# EasyEDA Pro project SOP100E 2025.05.27.eprj, board PCB1
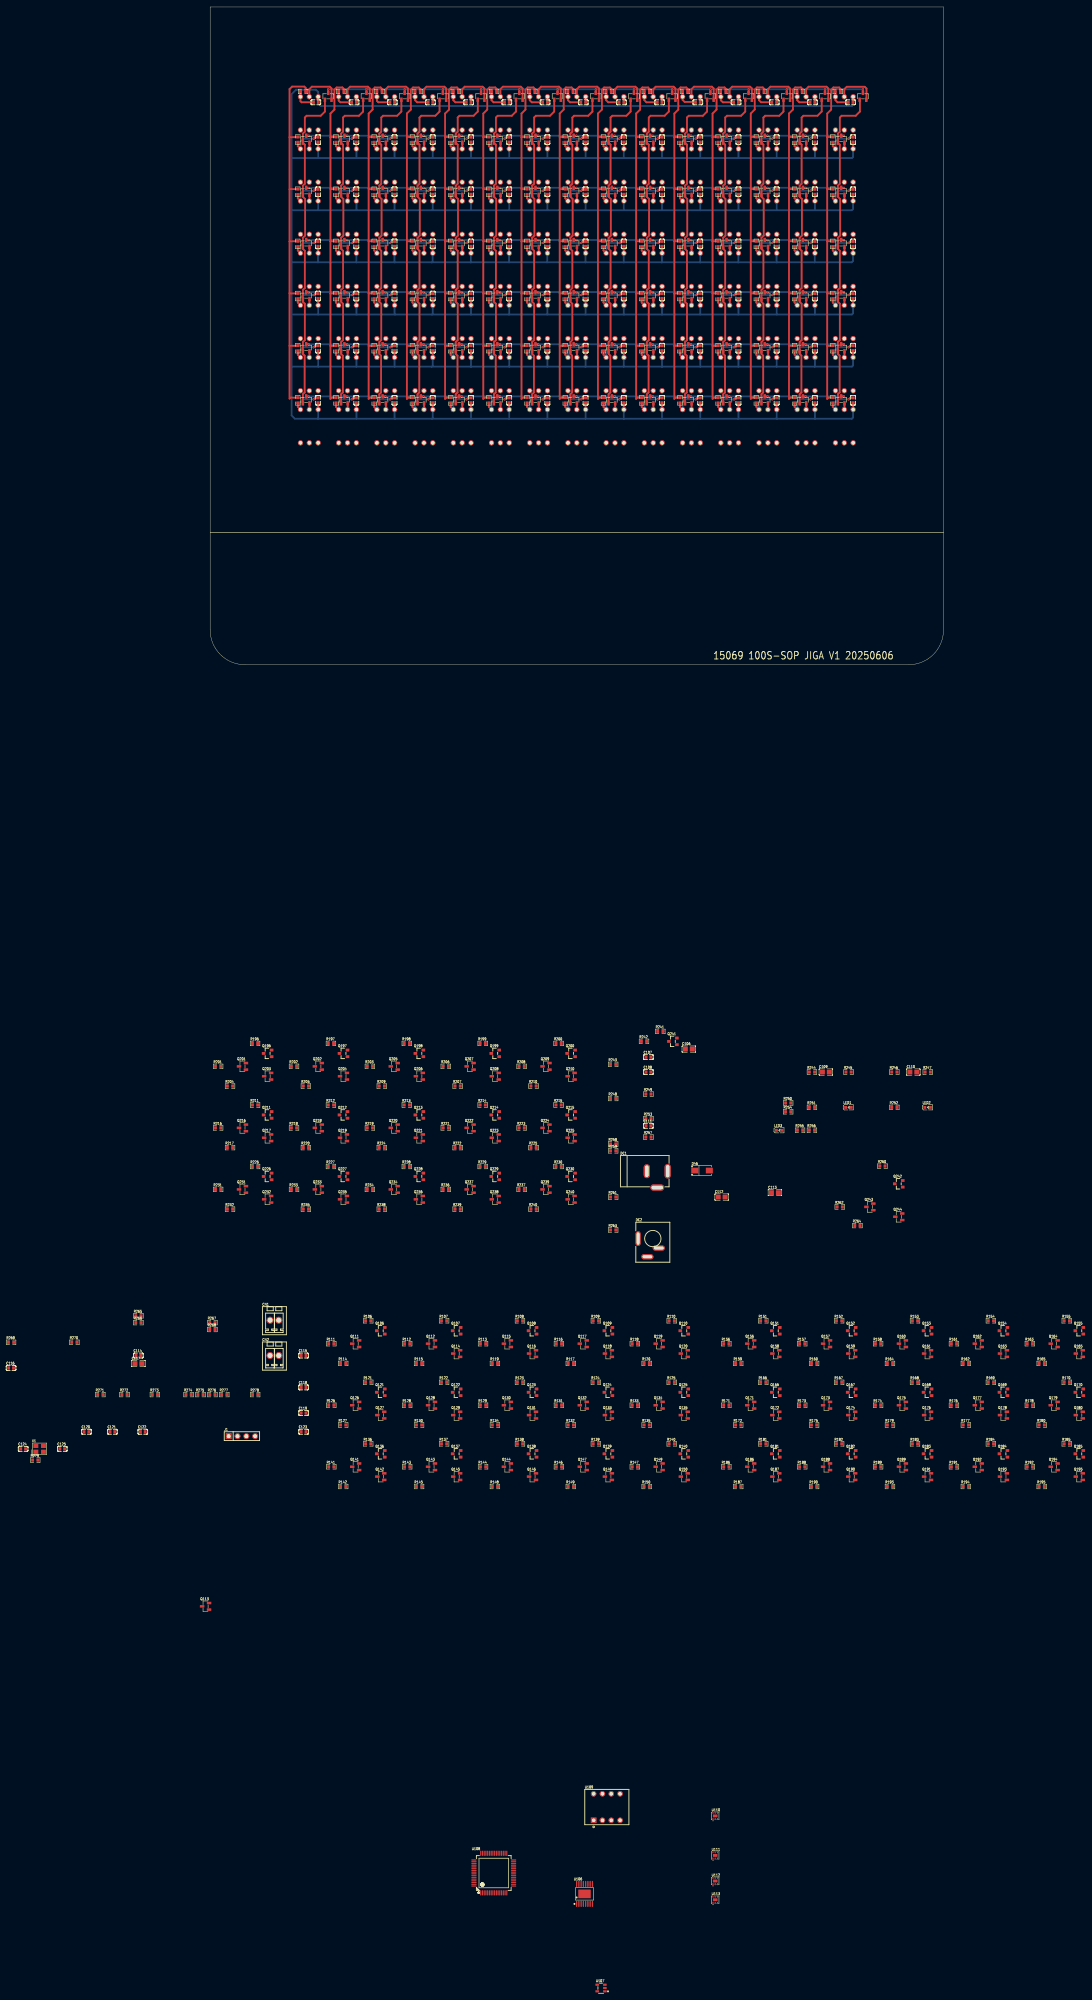
[diagram p15: board, top side]
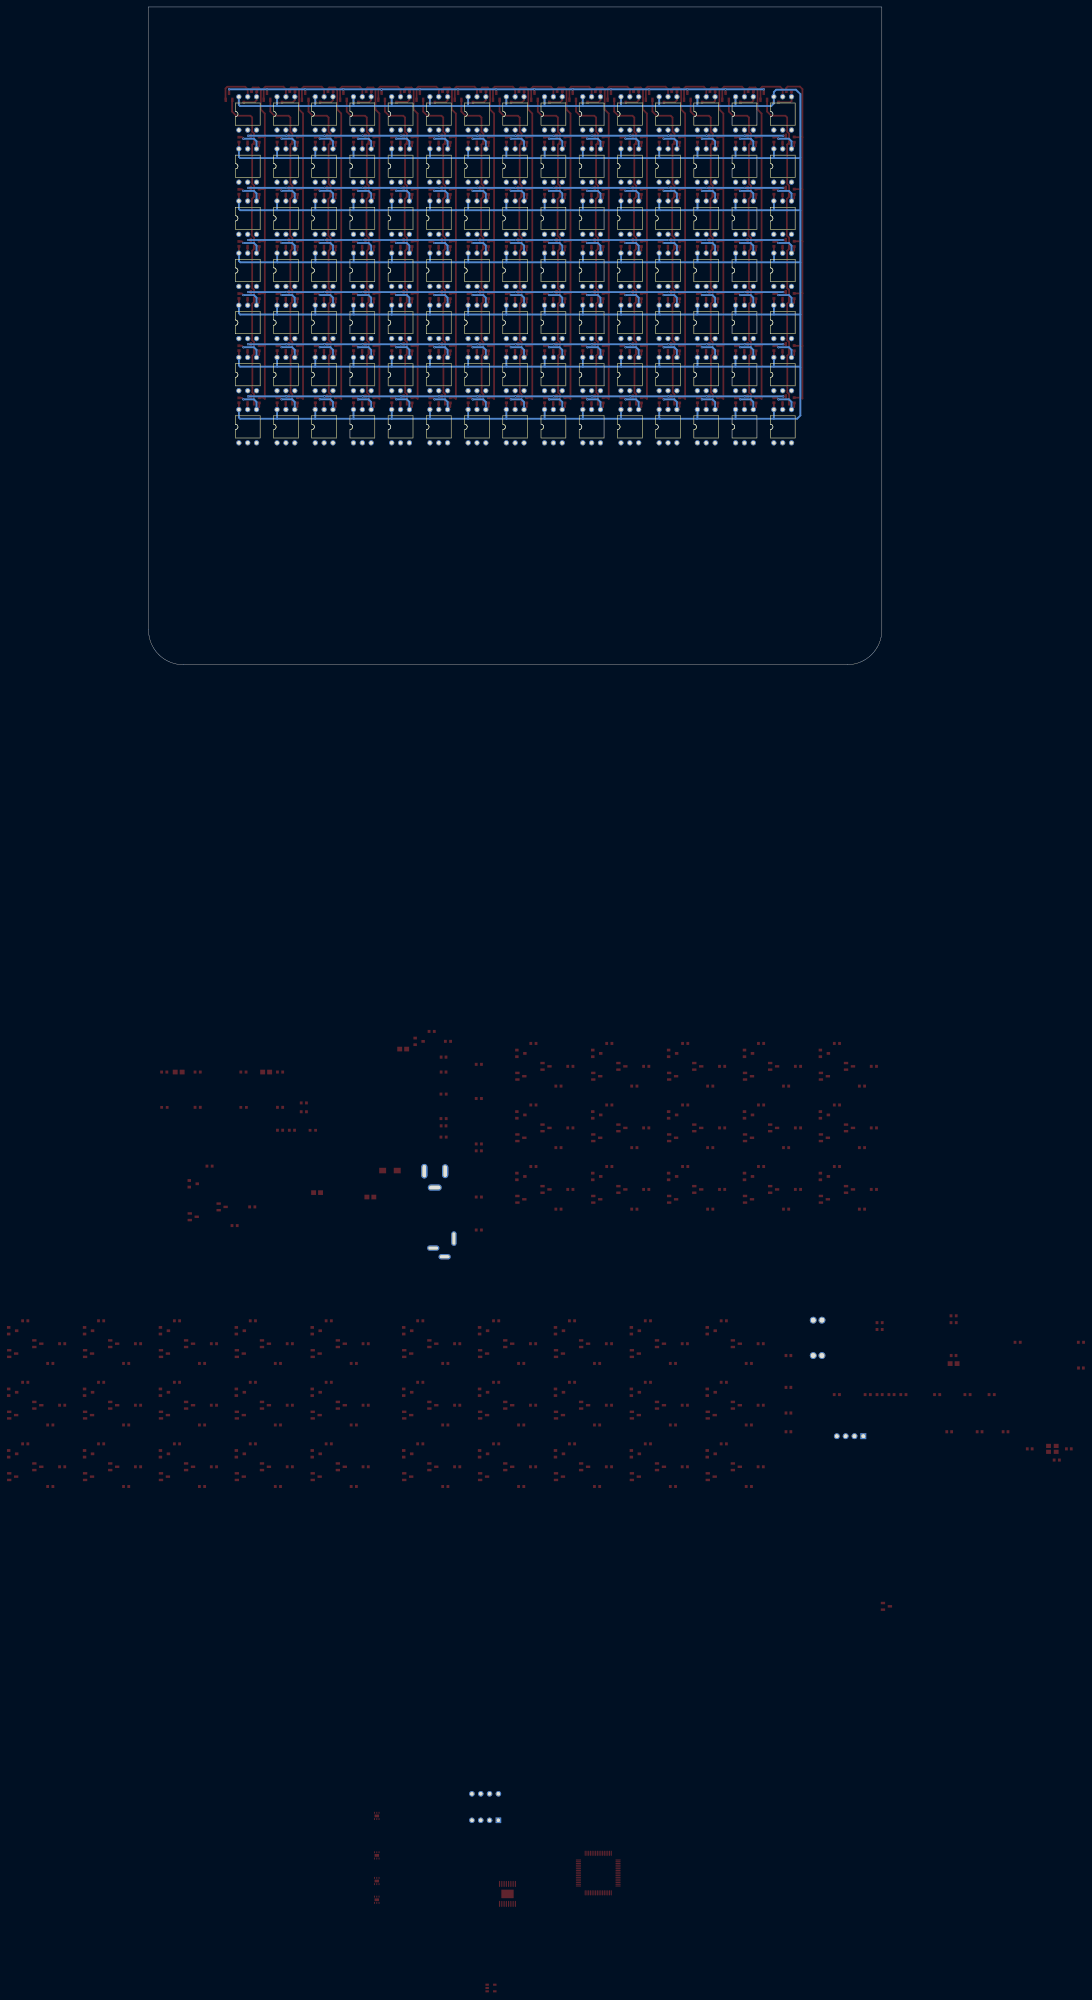
[diagram p16: board, bottom side, seen from below]

Outline 211.1 x 189.25 mm; copper layers: Top Layer, Inner1, Inner2, Bottom Layer. Coordinates in mm from the lower left corner of the outline.
Outline path: 0,189.25 211.1,189.25 211.1,10 arc(208.17,2.93) 201.1,0 10,0 arc(2.93,2.93) 0,10 0,189.25
Stack: Top Layer 0.035mm 外层铜厚1oz / Dielectric1 0.2104mm 7628 RC49% 8.6mil / Inner1 0.0152mm 内层铜厚 / Dielectric2 1.065mm 1.1mm H/HOZ Copper / Inner2 0.0152mm 内层铜厚 / Dielectric3 0.2104mm 7628 RC49% 8.6mil / Bottom Layer 0.035mm 外层铜厚1oz

## Design rules (mm)
template: JLCPCB Capability(Two Layers Board)
spacing copperThickness1oz (default): track to track 0.102, other pairs 0.152 to 0.3
spacing copperThickness2oz: track to track 0.203, other pairs 0.152 to 0.3
track width copperThickness1oz (default): min 0.127, default 0.254, max 2.54
track width copperThickness2oz: min 0.203, default 0.254, max 2.54
differential pair differentialPair (default): width min 0.127, default 0.254, max 2.54; gap min 0.152, default 0.152
via viaSize (default): diameter min 0.5, default 0.61, max 10; hole min 0.3, default 0.305, max 6.3

## Placement (name value [footprint] x y rotation side)
C1  100nF  [C0603]  30.43 161.82 180 top
C2  100nF  [C0603]  41.43 161.82 180 top
C3  100nF  [C0603]  52.42 161.82 180 top
C4  100nF  [C0603]  63.42 161.82 180 top
C5  100nF  [C0603]  74.41 161.82 180 top
C6  100nF  [C0603]  85.41 161.82 180 top
C7  100nF  [C0603]  96.41 161.82 180 top
C8  100nF  [C0603]  107.4 161.82 180 top
C9  100nF  [C0603]  118.4 161.82 180 top
C10  100nF  [C0603]  129.39 161.82 180 top
C11  100nF  [C0603]  140.39 161.82 180 top
C12  100nF  [C0603]  151.38 161.82 180 top
C13  100nF  [C0603]  162.38 161.82 180 top
C14  100nF  [C0603]  173.37 161.82 180 top
C15  100nF  [C0603]  184.37 161.82 180 top
C16  100nF  [C0603]  31.07 151.08 90 top
C17  100nF  [C0603]  42.07 151.08 90 top
C18  100nF  [C0603]  53.07 151.08 90 top
C19  100nF  [C0603]  64.07 151.08 90 top
C20  100nF  [C0603]  75.07 151.08 90 top
C21  100nF  [C0603]  86.07 151.08 90 top
C22  100nF  [C0603]  97.07 151.08 90 top
C23  100nF  [C0603]  108.07 151.08 90 top
C24  100nF  [C0603]  119.07 151.08 90 top
C25  100nF  [C0603]  130.07 151.08 90 top
C26  100nF  [C0603]  141.07 151.08 90 top
C27  100nF  [C0603]  152.07 151.08 90 top
C28  100nF  [C0603]  163.07 151.08 90 top
C29  100nF  [C0603]  174.07 151.08 90 top
C30  100nF  [C0603]  185.07 151.08 90 top
C31  100nF  [C0603]  31.07 136.08 90 top
C32  100nF  [C0603]  42.07 136.08 90 top
C33  100nF  [C0603]  53.07 136.08 90 top
C34  100nF  [C0603]  64.07 136.08 90 top
C35  100nF  [C0603]  75.07 136.08 90 top
C36  100nF  [C0603]  86.07 136.08 90 top
C37  100nF  [C0603]  97.07 136.08 90 top
C38  100nF  [C0603]  108.07 136.08 90 top
C39  100nF  [C0603]  119.07 136.08 90 top
C40  100nF  [C0603]  130.07 136.08 90 top
C41  100nF  [C0603]  141.07 136.08 90 top
C42  100nF  [C0603]  152.07 136.08 90 top
C43  100nF  [C0603]  163.07 136.08 90 top
C44  100nF  [C0603]  174.07 136.08 90 top
C45  100nF  [C0603]  185.07 136.08 90 top
C46  100nF  [C0603]  31.07 121.08 90 top
C47  100nF  [C0603]  42.07 121.08 90 top
C48  100nF  [C0603]  53.07 121.08 90 top
C49  100nF  [C0603]  64.07 121.08 90 top
C50  100nF  [C0603]  75.07 121.08 90 top
C51  100nF  [C0603]  86.07 121.08 90 top
C52  100nF  [C0603]  97.07 121.08 90 top
C53  100nF  [C0603]  108.07 121.08 90 top
C54  100nF  [C0603]  119.07 121.08 90 top
C55  100nF  [C0603]  130.07 121.08 90 top
C56  100nF  [C0603]  141.07 121.08 90 top
C57  100nF  [C0603]  152.07 121.08 90 top
C58  100nF  [C0603]  163.07 121.08 90 top
C59  100nF  [C0603]  174.07 121.08 90 top
C60  100nF  [C0603]  185.07 121.08 90 top
C61  100nF  [C0603]  31.07 106.08 90 top
C62  100nF  [C0603]  42.07 106.08 90 top
C63  100nF  [C0603]  53.07 106.08 90 top
C64  100nF  [C0603]  64.07 106.08 90 top
C65  100nF  [C0603]  75.07 106.08 90 top
C66  100nF  [C0603]  86.07 106.08 90 top
C67  100nF  [C0603]  97.07 106.08 90 top
C68  100nF  [C0603]  108.07 106.08 90 top
C69  100nF  [C0603]  119.07 106.08 90 top
C70  100nF  [C0603]  130.07 106.08 90 top
C71  100nF  [C0603]  141.07 106.08 90 top
C72  100nF  [C0603]  152.07 106.08 90 top
C73  100nF  [C0603]  163.07 106.08 90 top
C74  100nF  [C0603]  174.07 106.08 90 top
C75  100nF  [C0603]  185.07 106.08 90 top
C76  100nF  [C0603]  31.07 91.08 90 top
C77  100nF  [C0603]  42.07 91.08 90 top
C78  100nF  [C0603]  53.07 91.08 90 top
C79  100nF  [C0603]  64.07 91.08 90 top
C80  100nF  [C0603]  75.07 91.08 90 top
C81  100nF  [C0603]  86.07 91.08 90 top
C82  100nF  [C0603]  97.07 91.08 90 top
C83  100nF  [C0603]  108.07 91.08 90 top
C84  100nF  [C0603]  119.07 91.08 90 top
C85  100nF  [C0603]  130.07 91.08 90 top
C86  100nF  [C0603]  141.07 91.08 90 top
C87  100nF  [C0603]  152.07 91.08 90 top
C88  100nF  [C0603]  163.07 91.08 90 top
C89  100nF  [C0603]  174.07 91.08 90 top
C90  100nF  [C0603]  185.07 91.08 90 top
C91  100nF  [C0603]  31.07 76.08 90 top
C92  100nF  [C0603]  42.07 76.08 90 top
C93  100nF  [C0603]  53.07 76.08 90 top
C94  100nF  [C0603]  64.07 76.08 90 top
C95  100nF  [C0603]  75.07 76.08 90 top
C96  100nF  [C0603]  86.07 76.08 90 top
C97  100nF  [C0603]  97.07 76.08 90 top
C98  100nF  [C0603]  108.07 76.08 90 top
C99  100nF  [C0603]  119.07 76.08 90 top
C100  100nF  [C0603]  130.07 76.08 90 top
C101  100nF  [C0603]  141.07 76.08 90 top
C102  100nF  [C0603]  152.07 76.08 90 top
C103  100nF  [C0603]  163.07 76.08 90 top
C104  100nF  [C0603]  174.07 76.08 90 top
C105  100nF  [C0603]  185.07 76.08 90 top
C106  22uF  [C0805]  137.79 -110.59 0 top
C107  1uF  [C0603]  126.16 -112.91 0 top
C108  1uF  [C0603]  126.16 -117.2 0 top
C109  22uF  [C0805]  177.24 -117.2 0 top
C110  22uF  [C0805]  202.42 -117.2 0 top
C111  1uF  [C0603]  126.16 -132.68 0 top
C112  22uF  [C0805]  147.24 -153.16 0 top
C113  22uF  [C0805]  162.58 -151.9 0 top
C114  100nF  [C0603]  -20.66 -198.77 0 top
C115  100nF  [C0603]  26.9 -198.77 0 top
C116  100nF  [C0603]  -57.31 -202.36 0 top
C117  22uF  [C0805]  -20.66 -201.09 0 top
C118  100nF  [C0603]  26.9 -207.94 0 top
C119  100nF  [C0603]  26.9 -215.31 0 top
C120  100nF  [C0603]  -35.61 -220.7 0 top
C121  100nF  [C0603]  -28.14 -220.7 0 top
C122  100nF  [C0603]  -19.39 -220.7 0 top
C123  100nF  [C0603]  26.9 -220.7 0 top
C124  10pF  [C0603]  -53.83 -225.63 0 top
C125  10pF  [C0603]  -42.57 -225.63 0 top
CN1  DB2EVC-2.5-2P-GN  [CONN-TH_2P-P2.50_DB2EVC-2.5-2P-GN]  18.5 -188.6 0 top
CN2  DB2EVC-2.5-2P-GN  [CONN-TH_2P-P2.50_DB2EVC-2.5-2P-GN]  18.5 -198.77 0 top
D46  SS34  [SMA_L4.3-W2.5-LS5.0-RD]  141.6 -145.54 0 top
DC1  DC-005-5A-2.0  [DC-IN-TH_DC-005-5A-2.0]  128.7 -148.09 0 top
DC2  DC-012A-B200  [dc-in-th_dc-012a-b200]  126.16 -167.73 0 top
J1  PZ254V-11-04P  [HDR-TH_4P-P2.54-V-M]  9.15 -221.97 0 top
LED1  -  [LED_0603]  183.78 -127.36 0 top
LED2  -  [LED_0603]  206.57 -127.36 0 top
LED3  -  [LED_0603]  163.85 -133.95 0 top
Q1  AO3400A  [SOT-23-3_L2.9-W1.3-P1.90-LS2.4-BR]  33.99 163.54 270 top
Q2  AO3400A  [SOT-23-3_L2.9-W1.3-P1.90-LS2.4-BR]  44.99 163.54 270 top
Q3  AO3400A  [SOT-23-3_L2.9-W1.3-P1.90-LS2.4-BR]  55.99 163.54 270 top
Q4  AO3400A  [SOT-23-3_L2.9-W1.3-P1.90-LS2.4-BR]  66.99 163.54 270 top
Q5  AO3400A  [SOT-23-3_L2.9-W1.3-P1.90-LS2.4-BR]  77.99 163.54 270 top
Q6  AO3400A  [SOT-23-3_L2.9-W1.3-P1.90-LS2.4-BR]  88.99 163.54 270 top
Q7  AO3400A  [SOT-23-3_L2.9-W1.3-P1.90-LS2.4-BR]  99.99 163.54 270 top
Q8  AO3400A  [SOT-23-3_L2.9-W1.3-P1.90-LS2.4-BR]  110.99 163.54 270 top
Q9  AO3400A  [SOT-23-3_L2.9-W1.3-P1.90-LS2.4-BR]  121.99 163.54 270 top
Q10  AO3400A  [SOT-23-3_L2.9-W1.3-P1.90-LS2.4-BR]  132.99 163.54 270 top
Q11  AO3400A  [SOT-23-3_L2.9-W1.3-P1.90-LS2.4-BR]  143.99 163.54 270 top
Q12  AO3400A  [SOT-23-3_L2.9-W1.3-P1.90-LS2.4-BR]  154.99 163.54 270 top
Q13  AO3400A  [SOT-23-3_L2.9-W1.3-P1.90-LS2.4-BR]  165.99 163.54 270 top
Q14  AO3400A  [SOT-23-3_L2.9-W1.3-P1.90-LS2.4-BR]  176.99 163.54 270 top
Q15  AO3400A  [SOT-23-3_L2.9-W1.3-P1.90-LS2.4-BR]  187.91 163.54 270 top
Q16  AO3400A  [SOT-23-3_L2.9-W1.3-P1.90-LS2.4-BR]  27.64 151.2 270 top
Q17  AO3400A  [SOT-23-3_L2.9-W1.3-P1.90-LS2.4-BR]  38.64 151.2 270 top
Q18  AO3400A  [SOT-23-3_L2.9-W1.3-P1.90-LS2.4-BR]  49.64 151.2 270 top
Q19  AO3400A  [SOT-23-3_L2.9-W1.3-P1.90-LS2.4-BR]  60.64 151.2 270 top
Q20  AO3400A  [SOT-23-3_L2.9-W1.3-P1.90-LS2.4-BR]  71.64 151.2 270 top
Q21  AO3400A  [SOT-23-3_L2.9-W1.3-P1.90-LS2.4-BR]  82.64 151.2 270 top
Q22  AO3400A  [SOT-23-3_L2.9-W1.3-P1.90-LS2.4-BR]  93.64 151.2 270 top
Q23  AO3400A  [SOT-23-3_L2.9-W1.3-P1.90-LS2.4-BR]  104.64 151.2 270 top
Q24  AO3400A  [SOT-23-3_L2.9-W1.3-P1.90-LS2.4-BR]  115.64 151.2 270 top
Q25  AO3400A  [SOT-23-3_L2.9-W1.3-P1.90-LS2.4-BR]  126.64 151.2 270 top
Q26  AO3400A  [SOT-23-3_L2.9-W1.3-P1.90-LS2.4-BR]  137.64 151.2 270 top
Q27  AO3400A  [SOT-23-3_L2.9-W1.3-P1.90-LS2.4-BR]  148.64 151.2 270 top
Q28  AO3400A  [SOT-23-3_L2.9-W1.3-P1.90-LS2.4-BR]  159.64 151.2 270 top
Q29  AO3400A  [SOT-23-3_L2.9-W1.3-P1.90-LS2.4-BR]  170.64 151.2 270 top
Q30  AO3400A  [SOT-23-3_L2.9-W1.3-P1.90-LS2.4-BR]  181.64 151.2 270 top
Q31  AO3400A  [SOT-23-3_L2.9-W1.3-P1.90-LS2.4-BR]  27.64 136.2 270 top
Q32  AO3400A  [SOT-23-3_L2.9-W1.3-P1.90-LS2.4-BR]  38.64 136.2 270 top
Q33  AO3400A  [SOT-23-3_L2.9-W1.3-P1.90-LS2.4-BR]  49.64 136.2 270 top
Q34  AO3400A  [SOT-23-3_L2.9-W1.3-P1.90-LS2.4-BR]  60.64 136.2 270 top
Q35  AO3400A  [SOT-23-3_L2.9-W1.3-P1.90-LS2.4-BR]  71.64 136.2 270 top
Q36  AO3400A  [SOT-23-3_L2.9-W1.3-P1.90-LS2.4-BR]  82.64 136.2 270 top
Q37  AO3400A  [SOT-23-3_L2.9-W1.3-P1.90-LS2.4-BR]  93.64 136.2 270 top
Q38  AO3400A  [SOT-23-3_L2.9-W1.3-P1.90-LS2.4-BR]  104.64 136.2 270 top
Q39  AO3400A  [SOT-23-3_L2.9-W1.3-P1.90-LS2.4-BR]  115.64 136.2 270 top
Q40  AO3400A  [SOT-23-3_L2.9-W1.3-P1.90-LS2.4-BR]  126.64 136.2 270 top
Q41  AO3400A  [SOT-23-3_L2.9-W1.3-P1.90-LS2.4-BR]  137.64 136.2 270 top
Q42  AO3400A  [SOT-23-3_L2.9-W1.3-P1.90-LS2.4-BR]  148.64 136.2 270 top
Q43  AO3400A  [SOT-23-3_L2.9-W1.3-P1.90-LS2.4-BR]  159.64 136.2 270 top
Q44  AO3400A  [SOT-23-3_L2.9-W1.3-P1.90-LS2.4-BR]  170.64 136.2 270 top
Q45  AO3400A  [SOT-23-3_L2.9-W1.3-P1.90-LS2.4-BR]  181.64 136.2 270 top
Q46  AO3400A  [SOT-23-3_L2.9-W1.3-P1.90-LS2.4-BR]  27.64 121.2 270 top
Q47  AO3400A  [SOT-23-3_L2.9-W1.3-P1.90-LS2.4-BR]  38.64 121.2 270 top
Q48  AO3400A  [SOT-23-3_L2.9-W1.3-P1.90-LS2.4-BR]  49.64 121.2 270 top
Q49  AO3400A  [SOT-23-3_L2.9-W1.3-P1.90-LS2.4-BR]  60.64 121.2 270 top
Q50  AO3400A  [SOT-23-3_L2.9-W1.3-P1.90-LS2.4-BR]  71.64 121.2 270 top
Q51  AO3400A  [SOT-23-3_L2.9-W1.3-P1.90-LS2.4-BR]  82.64 121.2 270 top
Q52  AO3400A  [SOT-23-3_L2.9-W1.3-P1.90-LS2.4-BR]  93.64 121.2 270 top
Q53  AO3400A  [SOT-23-3_L2.9-W1.3-P1.90-LS2.4-BR]  104.64 121.2 270 top
Q54  AO3400A  [SOT-23-3_L2.9-W1.3-P1.90-LS2.4-BR]  115.64 121.2 270 top
Q55  AO3400A  [SOT-23-3_L2.9-W1.3-P1.90-LS2.4-BR]  126.64 121.2 270 top
Q56  AO3400A  [SOT-23-3_L2.9-W1.3-P1.90-LS2.4-BR]  137.64 121.2 270 top
Q57  AO3400A  [SOT-23-3_L2.9-W1.3-P1.90-LS2.4-BR]  148.64 121.2 270 top
Q58  AO3400A  [SOT-23-3_L2.9-W1.3-P1.90-LS2.4-BR]  159.64 121.2 270 top
Q59  AO3400A  [SOT-23-3_L2.9-W1.3-P1.90-LS2.4-BR]  170.64 121.2 270 top
Q60  AO3400A  [SOT-23-3_L2.9-W1.3-P1.90-LS2.4-BR]  181.64 121.2 270 top
Q61  AO3400A  [SOT-23-3_L2.9-W1.3-P1.90-LS2.4-BR]  27.64 106.2 270 top
Q62  AO3400A  [SOT-23-3_L2.9-W1.3-P1.90-LS2.4-BR]  38.64 106.2 270 top
Q63  AO3400A  [SOT-23-3_L2.9-W1.3-P1.90-LS2.4-BR]  49.64 106.2 270 top
Q64  AO3400A  [SOT-23-3_L2.9-W1.3-P1.90-LS2.4-BR]  60.64 106.2 270 top
Q65  AO3400A  [SOT-23-3_L2.9-W1.3-P1.90-LS2.4-BR]  71.64 106.2 270 top
Q66  AO3400A  [SOT-23-3_L2.9-W1.3-P1.90-LS2.4-BR]  82.64 106.2 270 top
Q67  AO3400A  [SOT-23-3_L2.9-W1.3-P1.90-LS2.4-BR]  93.64 106.2 270 top
Q68  AO3400A  [SOT-23-3_L2.9-W1.3-P1.90-LS2.4-BR]  104.64 106.2 270 top
Q69  AO3400A  [SOT-23-3_L2.9-W1.3-P1.90-LS2.4-BR]  115.64 106.2 270 top
Q70  AO3400A  [SOT-23-3_L2.9-W1.3-P1.90-LS2.4-BR]  126.64 106.2 270 top
Q71  AO3400A  [SOT-23-3_L2.9-W1.3-P1.90-LS2.4-BR]  137.64 106.2 270 top
Q72  AO3400A  [SOT-23-3_L2.9-W1.3-P1.90-LS2.4-BR]  148.64 106.2 270 top
Q73  AO3400A  [SOT-23-3_L2.9-W1.3-P1.90-LS2.4-BR]  159.64 106.2 270 top
Q74  AO3400A  [SOT-23-3_L2.9-W1.3-P1.90-LS2.4-BR]  170.64 106.2 270 top
Q75  AO3400A  [SOT-23-3_L2.9-W1.3-P1.90-LS2.4-BR]  181.64 106.2 270 top
Q76  AO3400A  [SOT-23-3_L2.9-W1.3-P1.90-LS2.4-BR]  27.64 91.2 270 top
Q77  AO3400A  [SOT-23-3_L2.9-W1.3-P1.90-LS2.4-BR]  38.64 91.2 270 top
Q78  AO3400A  [SOT-23-3_L2.9-W1.3-P1.90-LS2.4-BR]  49.64 91.2 270 top
Q79  AO3400A  [SOT-23-3_L2.9-W1.3-P1.90-LS2.4-BR]  60.64 91.2 270 top
Q80  AO3400A  [SOT-23-3_L2.9-W1.3-P1.90-LS2.4-BR]  71.64 91.2 270 top
Q81  AO3400A  [SOT-23-3_L2.9-W1.3-P1.90-LS2.4-BR]  82.64 91.2 270 top
Q82  AO3400A  [SOT-23-3_L2.9-W1.3-P1.90-LS2.4-BR]  93.64 91.2 270 top
Q83  AO3400A  [SOT-23-3_L2.9-W1.3-P1.90-LS2.4-BR]  104.64 91.2 270 top
Q84  AO3400A  [SOT-23-3_L2.9-W1.3-P1.90-LS2.4-BR]  115.64 91.2 270 top
Q85  AO3400A  [SOT-23-3_L2.9-W1.3-P1.90-LS2.4-BR]  126.64 91.2 270 top
Q86  AO3400A  [SOT-23-3_L2.9-W1.3-P1.90-LS2.4-BR]  137.64 91.2 270 top
Q87  AO3400A  [SOT-23-3_L2.9-W1.3-P1.90-LS2.4-BR]  148.64 91.2 270 top
Q88  AO3400A  [SOT-23-3_L2.9-W1.3-P1.90-LS2.4-BR]  159.64 91.2 270 top
Q89  AO3400A  [SOT-23-3_L2.9-W1.3-P1.90-LS2.4-BR]  170.64 91.2 270 top
Q90  AO3400A  [SOT-23-3_L2.9-W1.3-P1.90-LS2.4-BR]  181.64 91.2 270 top
Q91  AO3400A  [SOT-23-3_L2.9-W1.3-P1.90-LS2.4-BR]  27.64 76.2 270 top
Q92  AO3400A  [SOT-23-3_L2.9-W1.3-P1.90-LS2.4-BR]  38.64 76.2 270 top
Q93  AO3400A  [SOT-23-3_L2.9-W1.3-P1.90-LS2.4-BR]  49.64 76.2 270 top
Q94  AO3400A  [SOT-23-3_L2.9-W1.3-P1.90-LS2.4-BR]  60.64 76.2 270 top
Q95  AO3400A  [SOT-23-3_L2.9-W1.3-P1.90-LS2.4-BR]  71.64 76.2 270 top
Q96  AO3400A  [SOT-23-3_L2.9-W1.3-P1.90-LS2.4-BR]  82.64 76.2 270 top
Q97  AO3400A  [SOT-23-3_L2.9-W1.3-P1.90-LS2.4-BR]  93.64 76.2 270 top
Q98  AO3400A  [SOT-23-3_L2.9-W1.3-P1.90-LS2.4-BR]  104.64 76.2 270 top
Q99  AO3400A  [SOT-23-3_L2.9-W1.3-P1.90-LS2.4-BR]  115.64 76.2 270 top
Q100  AO3400A  [SOT-23-3_L2.9-W1.3-P1.90-LS2.4-BR]  126.64 76.2 270 top
Q101  AO3400A  [SOT-23-3_L2.9-W1.3-P1.90-LS2.4-BR]  137.64 76.2 270 top
Q102  AO3400A  [SOT-23-3_L2.9-W1.3-P1.90-LS2.4-BR]  148.64 76.2 270 top
Q103  AO3400A  [SOT-23-3_L2.9-W1.3-P1.90-LS2.4-BR]  159.64 76.2 270 top
Q104  AO3400A  [SOT-23-3_L2.9-W1.3-P1.90-LS2.4-BR]  170.64 76.2 270 top
Q105  AO3400A  [SOT-23-3_L2.9-W1.3-P1.90-LS2.4-BR]  181.64 76.2 270 top
Q106  AO3401A  [SOT-23_L2.9-W1.3-P1.90-LS2.4-BR]  49.11 -191.64 0 top
Q107  AO3401A  [SOT-23_L2.9-W1.3-P1.90-LS2.4-BR]  70.96 -191.64 0 top
Q108  AO3401A  [SOT-23_L2.9-W1.3-P1.90-LS2.4-BR]  92.8 -191.64 0 top
Q109  AO3401A  [SOT-23_L2.9-W1.3-P1.90-LS2.4-BR]  114.64 -191.64 0 top
Q110  AO3401A  [SOT-23_L2.9-W1.3-P1.90-LS2.4-BR]  136.49 -191.64 0 top
Q111  AO3400A  [SOT-23-3_L2.9-W1.3-P1.90-LS2.4-BR]  41.88 -195.37 0 top
Q112  AO3400A  [SOT-23-3_L2.9-W1.3-P1.90-LS2.4-BR]  63.73 -195.37 0 top
Q113  AO3400A  [SOT-23-3_L2.9-W1.3-P1.90-LS2.4-BR]  -1.32 -270.93 0 top
Q114  AO3400A  [SOT-23-3_L2.9-W1.3-P1.90-LS2.4-BR]  70.96 -198.2 0 top
Q115  AO3400A  [SOT-23-3_L2.9-W1.3-P1.90-LS2.4-BR]  85.57 -195.37 0 top
Q116  AO3400A  [SOT-23-3_L2.9-W1.3-P1.90-LS2.4-BR]  92.8 -198.2 0 top
Q117  AO3400A  [SOT-23-3_L2.9-W1.3-P1.90-LS2.4-BR]  107.41 -195.37 0 top
Q118  AO3400A  [SOT-23-3_L2.9-W1.3-P1.90-LS2.4-BR]  114.64 -198.2 0 top
Q119  AO3400A  [SOT-23-3_L2.9-W1.3-P1.90-LS2.4-BR]  129.25 -195.37 0 top
Q120  AO3400A  [SOT-23-3_L2.9-W1.3-P1.90-LS2.4-BR]  136.49 -198.2 0 top
Q121  AO3401A  [SOT-23_L2.9-W1.3-P1.90-LS2.4-BR]  49.11 -209.34 0 top
Q122  AO3401A  [SOT-23_L2.9-W1.3-P1.90-LS2.4-BR]  70.96 -209.34 0 top
Q123  AO3401A  [SOT-23_L2.9-W1.3-P1.90-LS2.4-BR]  92.8 -209.34 0 top
Q124  AO3401A  [SOT-23_L2.9-W1.3-P1.90-LS2.4-BR]  114.64 -209.34 0 top
Q125  AO3401A  [SOT-23_L2.9-W1.3-P1.90-LS2.4-BR]  136.49 -209.34 0 top
Q126  AO3400A  [SOT-23-3_L2.9-W1.3-P1.90-LS2.4-BR]  41.88 -213.07 0 top
Q127  AO3400A  [SOT-23-3_L2.9-W1.3-P1.90-LS2.4-BR]  49.11 -215.91 0 top
Q128  AO3400A  [SOT-23-3_L2.9-W1.3-P1.90-LS2.4-BR]  63.73 -213.07 0 top
Q129  AO3400A  [SOT-23-3_L2.9-W1.3-P1.90-LS2.4-BR]  70.96 -215.91 0 top
Q130  AO3400A  [SOT-23-3_L2.9-W1.3-P1.90-LS2.4-BR]  85.57 -213.07 0 top
Q131  AO3400A  [SOT-23-3_L2.9-W1.3-P1.90-LS2.4-BR]  92.8 -215.91 0 top
Q132  AO3400A  [SOT-23-3_L2.9-W1.3-P1.90-LS2.4-BR]  107.41 -213.07 0 top
Q133  AO3400A  [SOT-23-3_L2.9-W1.3-P1.90-LS2.4-BR]  114.64 -215.91 0 top
Q134  AO3400A  [SOT-23-3_L2.9-W1.3-P1.90-LS2.4-BR]  129.25 -213.07 0 top
Q135  AO3400A  [SOT-23-3_L2.9-W1.3-P1.90-LS2.4-BR]  136.49 -215.91 0 top
Q136  AO3401A  [SOT-23_L2.9-W1.3-P1.90-LS2.4-BR]  49.11 -227.05 0 top
Q137  AO3401A  [SOT-23_L2.9-W1.3-P1.90-LS2.4-BR]  70.96 -227.05 0 top
Q138  AO3401A  [SOT-23_L2.9-W1.3-P1.90-LS2.4-BR]  92.8 -227.05 0 top
Q139  AO3401A  [SOT-23_L2.9-W1.3-P1.90-LS2.4-BR]  114.64 -227.05 0 top
Q140  AO3401A  [SOT-23_L2.9-W1.3-P1.90-LS2.4-BR]  136.49 -227.05 0 top
Q141  AO3400A  [SOT-23-3_L2.9-W1.3-P1.90-LS2.4-BR]  41.88 -230.78 0 top
Q142  AO3400A  [SOT-23-3_L2.9-W1.3-P1.90-LS2.4-BR]  49.11 -233.61 0 top
Q143  AO3400A  [SOT-23-3_L2.9-W1.3-P1.90-LS2.4-BR]  63.73 -230.78 0 top
Q144  AO3400A  [SOT-23-3_L2.9-W1.3-P1.90-LS2.4-BR]  85.57 -230.78 0 top
Q145  AO3400A  [SOT-23-3_L2.9-W1.3-P1.90-LS2.4-BR]  70.96 -233.61 0 top
Q146  AO3400A  [SOT-23-3_L2.9-W1.3-P1.90-LS2.4-BR]  92.8 -233.61 0 top
Q147  AO3400A  [SOT-23-3_L2.9-W1.3-P1.90-LS2.4-BR]  107.41 -230.78 0 top
Q148  AO3400A  [SOT-23-3_L2.9-W1.3-P1.90-LS2.4-BR]  114.64 -233.61 0 top
Q149  AO3400A  [SOT-23-3_L2.9-W1.3-P1.90-LS2.4-BR]  129.25 -230.78 0 top
Q150  AO3400A  [SOT-23-3_L2.9-W1.3-P1.90-LS2.4-BR]  136.49 -233.61 0 top
Q151  AO3401A  [SOT-23_L2.9-W1.3-P1.90-LS2.4-BR]  162.83 -191.64 0 top
Q152  AO3401A  [SOT-23_L2.9-W1.3-P1.90-LS2.4-BR]  184.67 -191.64 0 top
Q153  AO3401A  [SOT-23_L2.9-W1.3-P1.90-LS2.4-BR]  206.51 -191.64 0 top
Q154  AO3401A  [SOT-23_L2.9-W1.3-P1.90-LS2.4-BR]  228.36 -191.64 0 top
Q155  AO3401A  [SOT-23_L2.9-W1.3-P1.90-LS2.4-BR]  250.2 -191.64 0 top
Q156  AO3400A  [SOT-23-3_L2.9-W1.3-P1.90-LS2.4-BR]  155.6 -195.37 0 top
Q157  AO3400A  [SOT-23-3_L2.9-W1.3-P1.90-LS2.4-BR]  177.44 -195.37 0 top
Q158  AO3400A  [SOT-23-3_L2.9-W1.3-P1.90-LS2.4-BR]  162.83 -198.2 0 top
Q159  AO3400A  [SOT-23-3_L2.9-W1.3-P1.90-LS2.4-BR]  184.67 -198.2 0 top
Q160  AO3400A  [SOT-23-3_L2.9-W1.3-P1.90-LS2.4-BR]  199.28 -195.37 0 top
Q161  AO3400A  [SOT-23-3_L2.9-W1.3-P1.90-LS2.4-BR]  206.51 -198.2 0 top
Q162  AO3400A  [SOT-23-3_L2.9-W1.3-P1.90-LS2.4-BR]  221.12 -195.37 0 top
Q163  AO3400A  [SOT-23-3_L2.9-W1.3-P1.90-LS2.4-BR]  228.36 -198.2 0 top
Q164  AO3400A  [SOT-23-3_L2.9-W1.3-P1.90-LS2.4-BR]  242.97 -195.37 0 top
Q165  AO3400A  [SOT-23-3_L2.9-W1.3-P1.90-LS2.4-BR]  250.2 -198.2 0 top
Q166  AO3401A  [SOT-23_L2.9-W1.3-P1.90-LS2.4-BR]  162.83 -209.34 0 top
Q167  AO3401A  [SOT-23_L2.9-W1.3-P1.90-LS2.4-BR]  184.67 -209.34 0 top
Q168  AO3401A  [SOT-23_L2.9-W1.3-P1.90-LS2.4-BR]  206.51 -209.34 0 top
Q169  AO3401A  [SOT-23_L2.9-W1.3-P1.90-LS2.4-BR]  228.36 -209.34 0 top
Q170  AO3401A  [SOT-23_L2.9-W1.3-P1.90-LS2.4-BR]  250.2 -209.34 0 top
Q171  AO3400A  [SOT-23-3_L2.9-W1.3-P1.90-LS2.4-BR]  155.6 -213.07 0 top
Q172  AO3400A  [SOT-23-3_L2.9-W1.3-P1.90-LS2.4-BR]  162.83 -215.91 0 top
Q173  AO3400A  [SOT-23-3_L2.9-W1.3-P1.90-LS2.4-BR]  177.44 -213.07 0 top
Q174  AO3400A  [SOT-23-3_L2.9-W1.3-P1.90-LS2.4-BR]  184.67 -215.91 0 top
Q175  AO3400A  [SOT-23-3_L2.9-W1.3-P1.90-LS2.4-BR]  199.28 -213.07 0 top
Q176  AO3400A  [SOT-23-3_L2.9-W1.3-P1.90-LS2.4-BR]  206.51 -215.91 0 top
Q177  AO3400A  [SOT-23-3_L2.9-W1.3-P1.90-LS2.4-BR]  221.12 -213.07 0 top
Q178  AO3400A  [SOT-23-3_L2.9-W1.3-P1.90-LS2.4-BR]  228.36 -215.91 0 top
Q179  AO3400A  [SOT-23-3_L2.9-W1.3-P1.90-LS2.4-BR]  242.97 -213.07 0 top
Q180  AO3400A  [SOT-23-3_L2.9-W1.3-P1.90-LS2.4-BR]  250.2 -215.91 0 top
Q181  AO3401A  [SOT-23_L2.9-W1.3-P1.90-LS2.4-BR]  162.83 -227.05 0 top
Q182  AO3401A  [SOT-23_L2.9-W1.3-P1.90-LS2.4-BR]  184.67 -227.05 0 top
Q183  AO3401A  [SOT-23_L2.9-W1.3-P1.90-LS2.4-BR]  206.51 -227.05 0 top
Q184  AO3401A  [SOT-23_L2.9-W1.3-P1.90-LS2.4-BR]  228.36 -227.05 0 top
Q185  AO3401A  [SOT-23_L2.9-W1.3-P1.90-LS2.4-BR]  250.2 -227.05 0 top
Q186  AO3400A  [SOT-23-3_L2.9-W1.3-P1.90-LS2.4-BR]  155.6 -230.78 0 top
Q187  AO3400A  [SOT-23-3_L2.9-W1.3-P1.90-LS2.4-BR]  162.83 -233.61 0 top
Q188  AO3400A  [SOT-23-3_L2.9-W1.3-P1.90-LS2.4-BR]  177.44 -230.78 0 top
Q189  AO3400A  [SOT-23-3_L2.9-W1.3-P1.90-LS2.4-BR]  199.28 -230.78 0 top
Q190  AO3400A  [SOT-23-3_L2.9-W1.3-P1.90-LS2.4-BR]  184.67 -233.61 0 top
Q191  AO3400A  [SOT-23-3_L2.9-W1.3-P1.90-LS2.4-BR]  206.51 -233.61 0 top
Q192  AO3400A  [SOT-23-3_L2.9-W1.3-P1.90-LS2.4-BR]  221.12 -230.78 0 top
Q193  AO3400A  [SOT-23-3_L2.9-W1.3-P1.90-LS2.4-BR]  228.36 -233.61 0 top
Q194  AO3400A  [SOT-23-3_L2.9-W1.3-P1.90-LS2.4-BR]  242.97 -230.78 0 top
Q195  AO3400A  [SOT-23-3_L2.9-W1.3-P1.90-LS2.4-BR]  250.2 -233.61 0 top
Q196  AO3401A  [SOT-23_L2.9-W1.3-P1.90-LS2.4-BR]  16.54 -111.84 0 top
Q197  AO3401A  [SOT-23_L2.9-W1.3-P1.90-LS2.4-BR]  38.38 -111.84 0 top
Q198  AO3401A  [SOT-23_L2.9-W1.3-P1.90-LS2.4-BR]  60.23 -111.84 0 top
Q199  AO3401A  [SOT-23_L2.9-W1.3-P1.90-LS2.4-BR]  82.07 -111.84 0 top
Q200  AO3401A  [SOT-23_L2.9-W1.3-P1.90-LS2.4-BR]  103.91 -111.84 0 top
Q201  AO3400A  [SOT-23-3_L2.9-W1.3-P1.90-LS2.4-BR]  9.31 -115.57 0 top
Q202  AO3400A  [SOT-23-3_L2.9-W1.3-P1.90-LS2.4-BR]  31.15 -115.57 0 top
Q203  AO3400A  [SOT-23-3_L2.9-W1.3-P1.90-LS2.4-BR]  16.54 -118.41 0 top
Q204  AO3400A  [SOT-23-3_L2.9-W1.3-P1.90-LS2.4-BR]  38.38 -118.41 0 top
Q205  AO3400A  [SOT-23-3_L2.9-W1.3-P1.90-LS2.4-BR]  52.99 -115.57 0 top
Q206  AO3400A  [SOT-23-3_L2.9-W1.3-P1.90-LS2.4-BR]  60.23 -118.41 0 top
Q207  AO3400A  [SOT-23-3_L2.9-W1.3-P1.90-LS2.4-BR]  74.84 -115.57 0 top
Q208  AO3400A  [SOT-23-3_L2.9-W1.3-P1.90-LS2.4-BR]  82.07 -118.41 0 top
Q209  AO3400A  [SOT-23-3_L2.9-W1.3-P1.90-LS2.4-BR]  96.68 -115.57 0 top
Q210  AO3400A  [SOT-23-3_L2.9-W1.3-P1.90-LS2.4-BR]  103.91 -118.41 0 top
Q211  AO3401A  [SOT-23_L2.9-W1.3-P1.90-LS2.4-BR]  16.54 -129.54 0 top
Q212  AO3401A  [SOT-23_L2.9-W1.3-P1.90-LS2.4-BR]  38.38 -129.54 0 top
Q213  AO3401A  [SOT-23_L2.9-W1.3-P1.90-LS2.4-BR]  60.23 -129.54 0 top
Q214  AO3401A  [SOT-23_L2.9-W1.3-P1.90-LS2.4-BR]  82.07 -129.54 0 top
Q215  AO3401A  [SOT-23_L2.9-W1.3-P1.90-LS2.4-BR]  103.91 -129.54 0 top
Q216  AO3400A  [SOT-23-3_L2.9-W1.3-P1.90-LS2.4-BR]  9.31 -133.27 0 top
Q217  AO3400A  [SOT-23-3_L2.9-W1.3-P1.90-LS2.4-BR]  16.54 -136.11 0 top
Q218  AO3400A  [SOT-23-3_L2.9-W1.3-P1.90-LS2.4-BR]  31.15 -133.27 0 top
Q219  AO3400A  [SOT-23-3_L2.9-W1.3-P1.90-LS2.4-BR]  38.38 -136.11 0 top
Q220  AO3400A  [SOT-23-3_L2.9-W1.3-P1.90-LS2.4-BR]  52.99 -133.27 0 top
Q221  AO3400A  [SOT-23-3_L2.9-W1.3-P1.90-LS2.4-BR]  60.23 -136.11 0 top
Q222  AO3400A  [SOT-23-3_L2.9-W1.3-P1.90-LS2.4-BR]  74.84 -133.27 0 top
Q223  AO3400A  [SOT-23-3_L2.9-W1.3-P1.90-LS2.4-BR]  82.07 -136.11 0 top
Q224  AO3400A  [SOT-23-3_L2.9-W1.3-P1.90-LS2.4-BR]  96.68 -133.27 0 top
Q225  AO3400A  [SOT-23-3_L2.9-W1.3-P1.90-LS2.4-BR]  103.91 -136.11 0 top
Q226  AO3401A  [SOT-23_L2.9-W1.3-P1.90-LS2.4-BR]  16.54 -147.25 0 top
Q227  AO3401A  [SOT-23_L2.9-W1.3-P1.90-LS2.4-BR]  38.38 -147.25 0 top
Q228  AO3401A  [SOT-23_L2.9-W1.3-P1.90-LS2.4-BR]  60.23 -147.25 0 top
Q229  AO3401A  [SOT-23_L2.9-W1.3-P1.90-LS2.4-BR]  82.07 -147.25 0 top
Q230  AO3401A  [SOT-23_L2.9-W1.3-P1.90-LS2.4-BR]  103.91 -147.25 0 top
Q231  AO3400A  [SOT-23-3_L2.9-W1.3-P1.90-LS2.4-BR]  9.31 -150.98 0 top
Q232  AO3400A  [SOT-23-3_L2.9-W1.3-P1.90-LS2.4-BR]  16.54 -153.82 0 top
Q233  AO3400A  [SOT-23-3_L2.9-W1.3-P1.90-LS2.4-BR]  31.15 -150.98 0 top
Q234  AO3400A  [SOT-23-3_L2.9-W1.3-P1.90-LS2.4-BR]  52.99 -150.98 0 top
Q235  AO3400A  [SOT-23-3_L2.9-W1.3-P1.90-LS2.4-BR]  38.38 -153.82 0 top
Q236  AO3400A  [SOT-23-3_L2.9-W1.3-P1.90-LS2.4-BR]  60.23 -153.82 0 top
Q237  AO3400A  [SOT-23-3_L2.9-W1.3-P1.90-LS2.4-BR]  74.84 -150.98 0 top
Q238  AO3400A  [SOT-23-3_L2.9-W1.3-P1.90-LS2.4-BR]  82.07 -153.82 0 top
Q239  AO3400A  [SOT-23-3_L2.9-W1.3-P1.90-LS2.4-BR]  96.68 -150.98 0 top
Q240  AO3400A  [SOT-23-3_L2.9-W1.3-P1.90-LS2.4-BR]  103.91 -153.82 0 top
Q241  AO3401A  [SOT-23_L2.9-W1.3-P1.90-LS2.4-BR]  133.2 -108.38 0 top
Q242  AO3401A  [SOT-23_L2.9-W1.3-P1.90-LS2.4-BR]  198.22 -149.35 0 top
Q243  AO3400A  [SOT-23-3_L2.9-W1.3-P1.90-LS2.4-BR]  189.9 -156 0 top
Q244  AO3400A  [SOT-23-3_L2.9-W1.3-P1.90-LS2.4-BR]  198.22 -158.84 0 top
R1  100R  [R0603]  26.75 164.93 180 top
R2  100R  [R0603]  37.75 164.93 180 top
R3  100R  [R0603]  48.74 164.93 180 top
R4  100R  [R0603]  59.74 164.93 180 top
R5  100R  [R0603]  70.73 164.93 180 top
R6  100R  [R0603]  81.72 164.93 180 top
R7  100R  [R0603]  92.72 164.93 180 top
R8  100R  [R0603]  103.71 164.93 180 top
R9  100R  [R0603]  114.71 164.93 180 top
R10  100R  [R0603]  125.7 164.93 180 top
R11  100R  [R0603]  136.7 164.93 180 top
R12  100R  [R0603]  147.69 164.93 180 top
R13  100R  [R0603]  158.69 164.93 180 top
R14  100R  [R0603]  169.68 164.93 180 top
R15  100R  [R0603]  180.68 164.93 180 top
R16  100R  [R0603]  25.23 151.08 270 top
R17  100R  [R0603]  36.23 151.08 270 top
R18  100R  [R0603]  47.23 151.08 270 top
R19  100R  [R0603]  58.23 151.08 270 top
R20  100R  [R0603]  69.23 151.08 270 top
R21  100R  [R0603]  80.23 151.08 270 top
R22  100R  [R0603]  91.23 151.08 270 top
R23  100R  [R0603]  102.23 151.08 270 top
R24  100R  [R0603]  113.23 151.08 270 top
R25  100R  [R0603]  124.23 151.08 270 top
R26  100R  [R0603]  135.23 151.08 270 top
R27  100R  [R0603]  146.23 151.08 270 top
R28  100R  [R0603]  157.23 151.08 270 top
R29  100R  [R0603]  168.23 151.08 270 top
R30  100R  [R0603]  179.23 151.08 270 top
R31  100R  [R0603]  25.23 136.08 270 top
R32  100R  [R0603]  36.23 136.08 270 top
R33  100R  [R0603]  47.23 136.08 270 top
R34  100R  [R0603]  58.23 136.08 270 top
R35  100R  [R0603]  69.23 136.08 270 top
R36  100R  [R0603]  80.23 136.08 270 top
R37  100R  [R0603]  91.23 136.08 270 top
R38  100R  [R0603]  102.23 136.08 270 top
R39  100R  [R0603]  113.23 136.08 270 top
R40  100R  [R0603]  124.23 136.08 270 top
R41  100R  [R0603]  135.23 136.08 270 top
R42  100R  [R0603]  146.23 136.08 270 top
R43  100R  [R0603]  157.23 136.08 270 top
R44  100R  [R0603]  168.23 136.08 270 top
R45  100R  [R0603]  179.23 136.08 270 top
R46  100R  [R0603]  25.23 121.08 270 top
R47  100R  [R0603]  36.23 121.08 270 top
R48  100R  [R0603]  47.23 121.08 270 top
R49  100R  [R0603]  58.23 121.08 270 top
R50  100R  [R0603]  69.23 121.08 270 top
R51  100R  [R0603]  80.23 121.08 270 top
R52  100R  [R0603]  91.23 121.08 270 top
R53  100R  [R0603]  102.23 121.08 270 top
R54  100R  [R0603]  113.23 121.08 270 top
R55  100R  [R0603]  124.23 121.08 270 top
R56  100R  [R0603]  135.23 121.08 270 top
R57  100R  [R0603]  146.23 121.08 270 top
R58  100R  [R0603]  157.23 121.08 270 top
R59  100R  [R0603]  168.23 121.08 270 top
R60  100R  [R0603]  179.23 121.08 270 top
R61  100R  [R0603]  25.23 106.08 270 top
R62  100R  [R0603]  36.23 106.08 270 top
R63  100R  [R0603]  47.23 106.08 270 top
R64  100R  [R0603]  58.23 106.08 270 top
R65  100R  [R0603]  69.23 106.08 270 top
R66  100R  [R0603]  80.23 106.08 270 top
R67  100R  [R0603]  91.23 106.08 270 top
R68  100R  [R0603]  102.23 106.08 270 top
R69  100R  [R0603]  113.23 106.08 270 top
R70  100R  [R0603]  124.23 106.08 270 top
R71  100R  [R0603]  135.23 106.08 270 top
R72  100R  [R0603]  146.23 106.08 270 top
R73  100R  [R0603]  157.23 106.08 270 top
R74  100R  [R0603]  168.23 106.08 270 top
R75  100R  [R0603]  179.23 106.08 270 top
R76  100R  [R0603]  25.23 91.08 270 top
R77  100R  [R0603]  36.23 91.08 270 top
R78  100R  [R0603]  47.23 91.08 270 top
R79  100R  [R0603]  58.23 91.08 270 top
R80  100R  [R0603]  69.23 91.08 270 top
R81  100R  [R0603]  80.23 91.08 270 top
R82  100R  [R0603]  91.23 91.08 270 top
R83  100R  [R0603]  102.23 91.08 270 top
R84  100R  [R0603]  113.23 91.08 270 top
R85  100R  [R0603]  124.23 91.08 270 top
R86  100R  [R0603]  135.23 91.08 270 top
R87  100R  [R0603]  146.23 91.08 270 top
R88  100R  [R0603]  157.23 91.08 270 top
R89  100R  [R0603]  168.23 91.08 270 top
R90  100R  [R0603]  179.23 91.08 270 top
R91  100R  [R0603]  25.23 76.08 270 top
R92  100R  [R0603]  36.23 76.08 270 top
R93  100R  [R0603]  47.23 76.08 270 top
R94  100R  [R0603]  58.23 76.08 270 top
R95  100R  [R0603]  69.23 76.08 270 top
R96  100R  [R0603]  80.23 76.08 270 top
R97  100R  [R0603]  91.23 76.08 270 top
R98  100R  [R0603]  102.23 76.08 270 top
R99  100R  [R0603]  113.23 76.08 270 top
R100  100R  [R0603]  124.23 76.08 270 top
R101  100R  [R0603]  135.23 76.08 270 top
R102  100R  [R0603]  146.23 76.08 270 top
R103  100R  [R0603]  157.23 76.08 270 top
R104  100R  [R0603]  168.23 76.08 270 top
R105  100R  [R0603]  179.23 76.08 270 top
R106  10K  [R0603]  45.5 -188.77 0 top
R107  10K  [R0603]  67.35 -188.77 0 top
R108  10K  [R0603]  89.19 -188.77 0 top
R109  10K  [R0603]  111.03 -188.77 0 top
R110  10K  [R0603]  132.87 -188.77 0 top
R111  10R  [R0603]  34.87 -195.37 0 top
R112  10R  [R0603]  56.72 -195.37 0 top
R113  10R  [R0603]  78.56 -195.37 0 top
R114  10K  [R0603]  38.3 -201.04 0 top
R115  10K  [R0603]  60.14 -201.04 0 top
R116  10R  [R0603]  100.4 -195.37 0 top
R117  10K  [R0603]  103.82 -201.04 0 top
R118  10R  [R0603]  122.24 -195.37 0 top
R119  10K  [R0603]  81.98 -201.04 0 top
R120  10K  [R0603]  125.67 -201.04 0 top
R121  10K  [R0603]  45.5 -206.48 0 top
R122  10K  [R0603]  67.35 -206.48 0 top
R123  10K  [R0603]  89.19 -206.48 0 top
R124  10K  [R0603]  111.03 -206.48 0 top
R125  10K  [R0603]  132.87 -206.48 0 top
R126  10R  [R0603]  34.87 -213.07 0 top
R127  10K  [R0603]  38.3 -218.75 0 top
R128  10R  [R0603]  56.72 -213.07 0 top
R129  10R  [R0603]  78.56 -213.07 0 top
R130  10K  [R0603]  60.14 -218.75 0 top
R131  10R  [R0603]  100.4 -213.07 0 top
R132  10K  [R0603]  103.82 -218.75 0 top
R133  10R  [R0603]  122.24 -213.07 0 top
R134  10K  [R0603]  81.98 -218.75 0 top
R135  10K  [R0603]  125.67 -218.75 0 top
R136  10K  [R0603]  45.5 -224.18 0 top
R137  10K  [R0603]  67.35 -224.18 0 top
R138  10K  [R0603]  89.19 -224.18 0 top
R139  10K  [R0603]  111.03 -224.18 0 top
R140  10K  [R0603]  132.87 -224.18 0 top
R141  10R  [R0603]  34.87 -230.78 0 top
R142  10K  [R0603]  38.3 -236.45 0 top
R143  10R  [R0603]  56.72 -230.78 0 top
R144  10R  [R0603]  78.56 -230.78 0 top
R145  10K  [R0603]  60.14 -236.45 0 top
R146  10R  [R0603]  100.4 -230.78 0 top
R147  10R  [R0603]  122.24 -230.78 0 top
R148  10K  [R0603]  81.98 -236.45 0 top
R149  10K  [R0603]  103.82 -236.45 0 top
R150  10K  [R0603]  125.67 -236.45 0 top
R151  10K  [R0603]  159.22 -188.77 0 top
R152  10K  [R0603]  181.06 -188.77 0 top
R153  10K  [R0603]  202.9 -188.77 0 top
R154  10K  [R0603]  224.75 -188.77 0 top
R155  10K  [R0603]  246.59 -188.77 0 top
R156  10R  [R0603]  148.59 -195.37 0 top
R157  10R  [R0603]  170.43 -195.37 0 top
R158  10R  [R0603]  192.27 -195.37 0 top
R159  10K  [R0603]  152.01 -201.04 0 top
R160  10K  [R0603]  173.85 -201.04 0 top
R161  10R  [R0603]  214.12 -195.37 0 top
R162  10K  [R0603]  217.54 -201.04 0 top
R163  10R  [R0603]  235.96 -195.37 0 top
R164  10K  [R0603]  195.7 -201.04 0 top
R165  10K  [R0603]  239.38 -201.04 0 top
R166  10K  [R0603]  159.22 -206.48 0 top
R167  10K  [R0603]  181.06 -206.48 0 top
R168  10K  [R0603]  202.9 -206.48 0 top
R169  10K  [R0603]  224.75 -206.48 0 top
R170  10K  [R0603]  246.59 -206.48 0 top
R171  10R  [R0603]  148.59 -213.07 0 top
R172  10K  [R0603]  152.01 -218.75 0 top
R173  10R  [R0603]  170.43 -213.07 0 top
R174  10R  [R0603]  192.27 -213.07 0 top
R175  10K  [R0603]  173.85 -218.75 0 top
R176  10R  [R0603]  214.12 -213.07 0 top
R177  10K  [R0603]  217.54 -218.75 0 top
R178  10R  [R0603]  235.96 -213.07 0 top
R179  10K  [R0603]  195.7 -218.75 0 top
R180  10K  [R0603]  239.38 -218.75 0 top
R181  10K  [R0603]  159.22 -224.18 0 top
R182  10K  [R0603]  181.06 -224.18 0 top
R183  10K  [R0603]  202.9 -224.18 0 top
R184  10K  [R0603]  224.75 -224.18 0 top
R185  10K  [R0603]  246.59 -224.18 0 top
R186  10R  [R0603]  148.59 -230.78 0 top
R187  10K  [R0603]  152.01 -236.45 0 top
R188  10R  [R0603]  170.43 -230.78 0 top
R189  10R  [R0603]  192.27 -230.78 0 top
R190  10K  [R0603]  173.85 -236.45 0 top
R191  10R  [R0603]  214.12 -230.78 0 top
R192  10R  [R0603]  235.96 -230.78 0 top
R193  10K  [R0603]  195.7 -236.45 0 top
R194  10K  [R0603]  217.54 -236.45 0 top
R195  10K  [R0603]  239.38 -236.45 0 top
R196  10K  [R0603]  12.93 -108.97 0 top
R197  10K  [R0603]  34.77 -108.97 0 top
R198  10K  [R0603]  56.62 -108.97 0 top
R199  10K  [R0603]  78.46 -108.97 0 top
R200  10K  [R0603]  100.3 -108.97 0 top
R201  10R  [R0603]  2.3 -115.57 0 top
R202  10R  [R0603]  24.14 -115.57 0 top
R203  10R  [R0603]  45.99 -115.57 0 top
R204  10K  [R0603]  5.72 -121.25 0 top
R205  10K  [R0603]  27.57 -121.25 0 top
R206  10R  [R0603]  67.83 -115.57 0 top
R207  10K  [R0603]  71.25 -121.25 0 top
R208  10R  [R0603]  89.67 -115.57 0 top
R209  10K  [R0603]  49.41 -121.25 0 top
R210  10K  [R0603]  93.09 -121.25 0 top
R211  10K  [R0603]  12.93 -126.68 0 top
R212  10K  [R0603]  34.77 -126.68 0 top
R213  10K  [R0603]  56.62 -126.68 0 top
R214  10K  [R0603]  78.46 -126.68 0 top
R215  10K  [R0603]  100.3 -126.68 0 top
R216  10R  [R0603]  2.3 -133.27 0 top
R217  10K  [R0603]  5.72 -138.95 0 top
R218  10R  [R0603]  24.14 -133.27 0 top
R219  10R  [R0603]  45.99 -133.27 0 top
R220  10K  [R0603]  27.57 -138.95 0 top
R221  10R  [R0603]  67.83 -133.27 0 top
R222  10K  [R0603]  71.25 -138.95 0 top
R223  10R  [R0603]  89.67 -133.27 0 top
R224  10K  [R0603]  49.41 -138.95 0 top
R225  10K  [R0603]  93.09 -138.95 0 top
R226  10K  [R0603]  12.93 -144.38 0 top
R227  10K  [R0603]  34.77 -144.38 0 top
R228  10K  [R0603]  56.62 -144.38 0 top
R229  10K  [R0603]  78.46 -144.38 0 top
R230  10K  [R0603]  100.3 -144.38 0 top
R231  10R  [R0603]  2.3 -150.98 0 top
R232  10K  [R0603]  5.72 -156.66 0 top
R233  10R  [R0603]  24.14 -150.98 0 top
R234  10R  [R0603]  45.99 -150.98 0 top
R235  10K  [R0603]  27.57 -156.66 0 top
R236  10R  [R0603]  67.83 -150.98 0 top
R237  10R  [R0603]  89.67 -150.98 0 top
R238  10K  [R0603]  49.41 -156.66 0 top
R239  10K  [R0603]  71.25 -156.66 0 top
R240  10K  [R0603]  93.09 -156.66 0 top
R241  10K  [R0603]  129.59 -105.51 0 top
R242  10R  [R0603]  124.89 -108.38 0 top
R243  10K  [R0603]  116.01 -114.98 0 top
R244  10K  [R0603]  173.24 -117.2 0 top
R245  2K  [R0603]  183.78 -117.2 0 top
R246  10K  [R0603]  196.95 -117.2 0 top
R247  2K  [R0603]  206.57 -117.2 0 top
R248  10K  [R0603]  116.01 -124.82 0 top
R249  4.7K  [R0603]  126.16 -123.55 0 top
R250  1K  [R0603]  166.39 -126.09 0 top
R251  3.3K  [R0603]  173.24 -127.36 0 top
R252  2K  [R0603]  196.95 -127.36 0 top
R253  4.7K  [R0603]  126.16 -130.6 0 top
R254  1K  [R0603]  166.39 -128.63 0 top
R255  2K  [R0603]  169.81 -133.95 0 top
R256  TDB  [R0603]  173.24 -133.95 0 top
R257  1K  [R0603]  126.16 -135.92 0 top
R258  10K  [R0603]  116.01 -137.9 0 top
R259  10K  [R0603]  116.01 -139.87 0 top
R260  10K  [R0603]  193.53 -144.28 0 top
R261  10K  [R0603]  116.01 -153.16 0 top
R262  10R  [R0603]  181.24 -156 0 top
R263  10K  [R0603]  116.01 -162.65 0 top
R264  10K  [R0603]  186.32 -161.38 0 top
R265  1k  [R0603]  -20.66 -187.33 0 top
R266  1k  [R0603]  -20.66 -189.31 0 top
R267  0  [R0603]  0.64 -189.31 0 top
R268  0  [R0603]  0.64 -191.28 0 top
R269  10K  [R0603]  -57.31 -194.96 0 top
R270  10K  [R0603]  -39.09 -194.96 0 top
R271  10K  [R0603]  -31.61 -210.01 0 top
R272  10K  [R0603]  -24.66 -210.01 0 top
R273  10K  [R0603]  -15.91 -210.01 0 top
R274  10K  [R0603]  -6.2 -210.01 0 top
R275  10K  [R0603]  -2.78 -210.01 0 top
R276  10K  [R0603]  0.64 -210.01 0 top
R277  10K  [R0603]  4.07 -210.01 0 top
R278  10K  [R0603]  12.96 -210.01 0 top
R279  1M  [R0603]  -50.35 -228.84 0 top
U1  WF100E 1BG S6 DA 0.5P4.5 AT  [SOP-6_L7.0-W7.0-P2.54-LS10.3-TL-CW]  28.54 158.42 180 bottom
U2  WF100E 1BG S6 DA 0.5P4.5 AT  [SOP-6_L7.0-W7.0-P2.54-LS10.3-TL-CW]  39.54 158.42 180 bottom
U3  WF100E 1BG S6 DA 0.5P4.5 AT  [SOP-6_L7.0-W7.0-P2.54-LS10.3-TL-CW]  50.54 158.42 180 bottom
U4  WF100E 1BG S6 DA 0.5P4.5 AT  [SOP-6_L7.0-W7.0-P2.54-LS10.3-TL-CW]  61.54 158.42 180 bottom
U5  WF100E 1BG S6 DA 0.5P4.5 AT  [SOP-6_L7.0-W7.0-P2.54-LS10.3-TL-CW]  72.54 158.42 180 bottom
U6  WF100E 1BG S6 DA 0.5P4.5 AT  [SOP-6_L7.0-W7.0-P2.54-LS10.3-TL-CW]  83.54 158.42 180 bottom
U7  WF100E 1BG S6 DA 0.5P4.5 AT  [SOP-6_L7.0-W7.0-P2.54-LS10.3-TL-CW]  94.54 158.42 180 bottom
U8  WF100E 1BG S6 DA 0.5P4.5 AT  [SOP-6_L7.0-W7.0-P2.54-LS10.3-TL-CW]  105.54 158.42 180 bottom
U9  WF100E 1BG S6 DA 0.5P4.5 AT  [SOP-6_L7.0-W7.0-P2.54-LS10.3-TL-CW]  116.54 158.42 180 bottom
U10  WF100E 1BG S6 DA 0.5P4.5 AT  [SOP-6_L7.0-W7.0-P2.54-LS10.3-TL-CW]  127.54 158.42 180 bottom
U11  WF100E 1BG S6 DA 0.5P4.5 AT  [SOP-6_L7.0-W7.0-P2.54-LS10.3-TL-CW]  138.54 158.42 180 bottom
U12  WF100E 1BG S6 DA 0.5P4.5 AT  [SOP-6_L7.0-W7.0-P2.54-LS10.3-TL-CW]  149.54 158.42 180 bottom
U13  WF100E 1BG S6 DA 0.5P4.5 AT  [SOP-6_L7.0-W7.0-P2.54-LS10.3-TL-CW]  160.54 158.42 180 bottom
U14  WF100E 1BG S6 DA 0.5P4.5 AT  [SOP-6_L7.0-W7.0-P2.54-LS10.3-TL-CW]  171.54 158.42 180 bottom
U15  WF100E 1BG S6 DA 0.5P4.5 AT  [SOP-6_L7.0-W7.0-P2.54-LS10.3-TL-CW]  182.54 158.42 180 bottom
U16  WF100E 1BG S6 DA 0.5P4.5 AT  [SOP-6_L7.0-W7.0-P2.54-LS10.3-TL-CW]  28.54 143.42 180 bottom
U17  WF100E 1BG S6 DA 0.5P4.5 AT  [SOP-6_L7.0-W7.0-P2.54-LS10.3-TL-CW]  39.54 143.42 180 bottom
U18  WF100E 1BG S6 DA 0.5P4.5 AT  [SOP-6_L7.0-W7.0-P2.54-LS10.3-TL-CW]  50.54 143.42 180 bottom
U19  WF100E 1BG S6 DA 0.5P4.5 AT  [SOP-6_L7.0-W7.0-P2.54-LS10.3-TL-CW]  61.54 143.42 180 bottom
U20  WF100E 1BG S6 DA 0.5P4.5 AT  [SOP-6_L7.0-W7.0-P2.54-LS10.3-TL-CW]  72.54 143.42 180 bottom
U21  WF100E 1BG S6 DA 0.5P4.5 AT  [SOP-6_L7.0-W7.0-P2.54-LS10.3-TL-CW]  83.54 143.42 180 bottom
U22  WF100E 1BG S6 DA 0.5P4.5 AT  [SOP-6_L7.0-W7.0-P2.54-LS10.3-TL-CW]  94.54 143.42 180 bottom
U23  WF100E 1BG S6 DA 0.5P4.5 AT  [SOP-6_L7.0-W7.0-P2.54-LS10.3-TL-CW]  105.54 143.42 180 bottom
U24  WF100E 1BG S6 DA 0.5P4.5 AT  [SOP-6_L7.0-W7.0-P2.54-LS10.3-TL-CW]  116.54 143.42 180 bottom
U25  WF100E 1BG S6 DA 0.5P4.5 AT  [SOP-6_L7.0-W7.0-P2.54-LS10.3-TL-CW]  127.54 143.42 180 bottom
U26  WF100E 1BG S6 DA 0.5P4.5 AT  [SOP-6_L7.0-W7.0-P2.54-LS10.3-TL-CW]  138.54 143.42 180 bottom
U27  WF100E 1BG S6 DA 0.5P4.5 AT  [SOP-6_L7.0-W7.0-P2.54-LS10.3-TL-CW]  149.54 143.42 180 bottom
U28  WF100E 1BG S6 DA 0.5P4.5 AT  [SOP-6_L7.0-W7.0-P2.54-LS10.3-TL-CW]  160.54 143.42 180 bottom
U29  WF100E 1BG S6 DA 0.5P4.5 AT  [SOP-6_L7.0-W7.0-P2.54-LS10.3-TL-CW]  171.54 143.42 180 bottom
U30  WF100E 1BG S6 DA 0.5P4.5 AT  [SOP-6_L7.0-W7.0-P2.54-LS10.3-TL-CW]  182.54 143.42 180 bottom
U31  WF100E 1BG S6 DA 0.5P4.5 AT  [SOP-6_L7.0-W7.0-P2.54-LS10.3-TL-CW]  28.54 128.42 180 bottom
U32  WF100E 1BG S6 DA 0.5P4.5 AT  [SOP-6_L7.0-W7.0-P2.54-LS10.3-TL-CW]  39.54 128.42 180 bottom
U33  WF100E 1BG S6 DA 0.5P4.5 AT  [SOP-6_L7.0-W7.0-P2.54-LS10.3-TL-CW]  50.54 128.42 180 bottom
U34  WF100E 1BG S6 DA 0.5P4.5 AT  [SOP-6_L7.0-W7.0-P2.54-LS10.3-TL-CW]  61.54 128.42 180 bottom
U35  WF100E 1BG S6 DA 0.5P4.5 AT  [SOP-6_L7.0-W7.0-P2.54-LS10.3-TL-CW]  72.54 128.42 180 bottom
U36  WF100E 1BG S6 DA 0.5P4.5 AT  [SOP-6_L7.0-W7.0-P2.54-LS10.3-TL-CW]  83.54 128.42 180 bottom
U37  WF100E 1BG S6 DA 0.5P4.5 AT  [SOP-6_L7.0-W7.0-P2.54-LS10.3-TL-CW]  94.54 128.42 180 bottom
U38  WF100E 1BG S6 DA 0.5P4.5 AT  [SOP-6_L7.0-W7.0-P2.54-LS10.3-TL-CW]  105.54 128.42 180 bottom
U39  WF100E 1BG S6 DA 0.5P4.5 AT  [SOP-6_L7.0-W7.0-P2.54-LS10.3-TL-CW]  116.54 128.42 180 bottom
U40  WF100E 1BG S6 DA 0.5P4.5 AT  [SOP-6_L7.0-W7.0-P2.54-LS10.3-TL-CW]  127.54 128.42 180 bottom
U41  WF100E 1BG S6 DA 0.5P4.5 AT  [SOP-6_L7.0-W7.0-P2.54-LS10.3-TL-CW]  138.54 128.42 180 bottom
U42  WF100E 1BG S6 DA 0.5P4.5 AT  [SOP-6_L7.0-W7.0-P2.54-LS10.3-TL-CW]  149.54 128.42 180 bottom
U43  WF100E 1BG S6 DA 0.5P4.5 AT  [SOP-6_L7.0-W7.0-P2.54-LS10.3-TL-CW]  160.54 128.42 180 bottom
U44  WF100E 1BG S6 DA 0.5P4.5 AT  [SOP-6_L7.0-W7.0-P2.54-LS10.3-TL-CW]  171.54 128.42 180 bottom
U45  WF100E 1BG S6 DA 0.5P4.5 AT  [SOP-6_L7.0-W7.0-P2.54-LS10.3-TL-CW]  182.54 128.42 180 bottom
U46  WF100E 1BG S6 DA 0.5P4.5 AT  [SOP-6_L7.0-W7.0-P2.54-LS10.3-TL-CW]  28.54 113.42 180 bottom
U47  WF100E 1BG S6 DA 0.5P4.5 AT  [SOP-6_L7.0-W7.0-P2.54-LS10.3-TL-CW]  39.54 113.42 180 bottom
U48  WF100E 1BG S6 DA 0.5P4.5 AT  [SOP-6_L7.0-W7.0-P2.54-LS10.3-TL-CW]  50.54 113.42 180 bottom
U49  WF100E 1BG S6 DA 0.5P4.5 AT  [SOP-6_L7.0-W7.0-P2.54-LS10.3-TL-CW]  61.54 113.42 180 bottom
U50  WF100E 1BG S6 DA 0.5P4.5 AT  [SOP-6_L7.0-W7.0-P2.54-LS10.3-TL-CW]  72.54 113.42 180 bottom
U51  WF100E 1BG S6 DA 0.5P4.5 AT  [SOP-6_L7.0-W7.0-P2.54-LS10.3-TL-CW]  83.54 113.42 180 bottom
U52  WF100E 1BG S6 DA 0.5P4.5 AT  [SOP-6_L7.0-W7.0-P2.54-LS10.3-TL-CW]  94.54 113.42 180 bottom
U53  WF100E 1BG S6 DA 0.5P4.5 AT  [SOP-6_L7.0-W7.0-P2.54-LS10.3-TL-CW]  105.54 113.42 180 bottom
U54  WF100E 1BG S6 DA 0.5P4.5 AT  [SOP-6_L7.0-W7.0-P2.54-LS10.3-TL-CW]  116.54 113.42 180 bottom
U55  WF100E 1BG S6 DA 0.5P4.5 AT  [SOP-6_L7.0-W7.0-P2.54-LS10.3-TL-CW]  127.54 113.42 180 bottom
U56  WF100E 1BG S6 DA 0.5P4.5 AT  [SOP-6_L7.0-W7.0-P2.54-LS10.3-TL-CW]  138.54 113.42 180 bottom
U57  WF100E 1BG S6 DA 0.5P4.5 AT  [SOP-6_L7.0-W7.0-P2.54-LS10.3-TL-CW]  149.54 113.42 180 bottom
U58  WF100E 1BG S6 DA 0.5P4.5 AT  [SOP-6_L7.0-W7.0-P2.54-LS10.3-TL-CW]  160.54 113.42 180 bottom
U59  WF100E 1BG S6 DA 0.5P4.5 AT  [SOP-6_L7.0-W7.0-P2.54-LS10.3-TL-CW]  171.54 113.42 180 bottom
U60  WF100E 1BG S6 DA 0.5P4.5 AT  [SOP-6_L7.0-W7.0-P2.54-LS10.3-TL-CW]  182.54 113.42 180 bottom
U61  WF100E 1BG S6 DA 0.5P4.5 AT  [SOP-6_L7.0-W7.0-P2.54-LS10.3-TL-CW]  28.54 98.42 180 bottom
U62  WF100E 1BG S6 DA 0.5P4.5 AT  [SOP-6_L7.0-W7.0-P2.54-LS10.3-TL-CW]  39.54 98.42 180 bottom
U63  WF100E 1BG S6 DA 0.5P4.5 AT  [SOP-6_L7.0-W7.0-P2.54-LS10.3-TL-CW]  50.54 98.42 180 bottom
U64  WF100E 1BG S6 DA 0.5P4.5 AT  [SOP-6_L7.0-W7.0-P2.54-LS10.3-TL-CW]  61.54 98.42 180 bottom
U65  WF100E 1BG S6 DA 0.5P4.5 AT  [SOP-6_L7.0-W7.0-P2.54-LS10.3-TL-CW]  72.54 98.42 180 bottom
U66  WF100E 1BG S6 DA 0.5P4.5 AT  [SOP-6_L7.0-W7.0-P2.54-LS10.3-TL-CW]  83.54 98.42 180 bottom
U67  WF100E 1BG S6 DA 0.5P4.5 AT  [SOP-6_L7.0-W7.0-P2.54-LS10.3-TL-CW]  94.54 98.42 180 bottom
U68  WF100E 1BG S6 DA 0.5P4.5 AT  [SOP-6_L7.0-W7.0-P2.54-LS10.3-TL-CW]  105.54 98.42 180 bottom
U69  WF100E 1BG S6 DA 0.5P4.5 AT  [SOP-6_L7.0-W7.0-P2.54-LS10.3-TL-CW]  116.54 98.42 180 bottom
U70  WF100E 1BG S6 DA 0.5P4.5 AT  [SOP-6_L7.0-W7.0-P2.54-LS10.3-TL-CW]  127.54 98.42 180 bottom
U71  WF100E 1BG S6 DA 0.5P4.5 AT  [SOP-6_L7.0-W7.0-P2.54-LS10.3-TL-CW]  138.54 98.42 180 bottom
U72  WF100E 1BG S6 DA 0.5P4.5 AT  [SOP-6_L7.0-W7.0-P2.54-LS10.3-TL-CW]  149.54 98.42 180 bottom
U73  WF100E 1BG S6 DA 0.5P4.5 AT  [SOP-6_L7.0-W7.0-P2.54-LS10.3-TL-CW]  160.54 98.42 180 bottom
U74  WF100E 1BG S6 DA 0.5P4.5 AT  [SOP-6_L7.0-W7.0-P2.54-LS10.3-TL-CW]  171.54 98.42 180 bottom
U75  WF100E 1BG S6 DA 0.5P4.5 AT  [SOP-6_L7.0-W7.0-P2.54-LS10.3-TL-CW]  182.54 98.42 180 bottom
U76  WF100E 1BG S6 DA 0.5P4.5 AT  [SOP-6_L7.0-W7.0-P2.54-LS10.3-TL-CW]  28.54 83.42 180 bottom
U77  WF100E 1BG S6 DA 0.5P4.5 AT  [SOP-6_L7.0-W7.0-P2.54-LS10.3-TL-CW]  39.54 83.42 180 bottom
U78  WF100E 1BG S6 DA 0.5P4.5 AT  [SOP-6_L7.0-W7.0-P2.54-LS10.3-TL-CW]  50.54 83.42 180 bottom
U79  WF100E 1BG S6 DA 0.5P4.5 AT  [SOP-6_L7.0-W7.0-P2.54-LS10.3-TL-CW]  61.54 83.42 180 bottom
U80  WF100E 1BG S6 DA 0.5P4.5 AT  [SOP-6_L7.0-W7.0-P2.54-LS10.3-TL-CW]  72.54 83.42 180 bottom
U81  WF100E 1BG S6 DA 0.5P4.5 AT  [SOP-6_L7.0-W7.0-P2.54-LS10.3-TL-CW]  83.54 83.42 180 bottom
U82  WF100E 1BG S6 DA 0.5P4.5 AT  [SOP-6_L7.0-W7.0-P2.54-LS10.3-TL-CW]  94.54 83.42 180 bottom
U83  WF100E 1BG S6 DA 0.5P4.5 AT  [SOP-6_L7.0-W7.0-P2.54-LS10.3-TL-CW]  105.54 83.42 180 bottom
U84  WF100E 1BG S6 DA 0.5P4.5 AT  [SOP-6_L7.0-W7.0-P2.54-LS10.3-TL-CW]  116.54 83.42 180 bottom
U85  WF100E 1BG S6 DA 0.5P4.5 AT  [SOP-6_L7.0-W7.0-P2.54-LS10.3-TL-CW]  127.54 83.42 180 bottom
U86  WF100E 1BG S6 DA 0.5P4.5 AT  [SOP-6_L7.0-W7.0-P2.54-LS10.3-TL-CW]  138.54 83.42 180 bottom
U87  WF100E 1BG S6 DA 0.5P4.5 AT  [SOP-6_L7.0-W7.0-P2.54-LS10.3-TL-CW]  149.54 83.42 180 bottom
U88  WF100E 1BG S6 DA 0.5P4.5 AT  [SOP-6_L7.0-W7.0-P2.54-LS10.3-TL-CW]  160.54 83.42 180 bottom
U89  WF100E 1BG S6 DA 0.5P4.5 AT  [SOP-6_L7.0-W7.0-P2.54-LS10.3-TL-CW]  171.54 83.42 180 bottom
U90  WF100E 1BG S6 DA 0.5P4.5 AT  [SOP-6_L7.0-W7.0-P2.54-LS10.3-TL-CW]  182.54 83.42 180 bottom
U91  WF100E 1BG S6 DA 0.5P4.5 AT  [SOP-6_L7.0-W7.0-P2.54-LS10.3-TL-CW]  28.54 68.42 180 bottom
U92  WF100E 1BG S6 DA 0.5P4.5 AT  [SOP-6_L7.0-W7.0-P2.54-LS10.3-TL-CW]  39.54 68.42 180 bottom
U93  WF100E 1BG S6 DA 0.5P4.5 AT  [SOP-6_L7.0-W7.0-P2.54-LS10.3-TL-CW]  50.54 68.42 180 bottom
U94  WF100E 1BG S6 DA 0.5P4.5 AT  [SOP-6_L7.0-W7.0-P2.54-LS10.3-TL-CW]  61.54 68.42 180 bottom
U95  WF100E 1BG S6 DA 0.5P4.5 AT  [SOP-6_L7.0-W7.0-P2.54-LS10.3-TL-CW]  72.54 68.42 180 bottom
U96  WF100E 1BG S6 DA 0.5P4.5 AT  [SOP-6_L7.0-W7.0-P2.54-LS10.3-TL-CW]  83.54 68.42 180 bottom
U97  WF100E 1BG S6 DA 0.5P4.5 AT  [SOP-6_L7.0-W7.0-P2.54-LS10.3-TL-CW]  94.54 68.42 180 bottom
U98  WF100E 1BG S6 DA 0.5P4.5 AT  [SOP-6_L7.0-W7.0-P2.54-LS10.3-TL-CW]  105.54 68.42 180 bottom
U99  WF100E 1BG S6 DA 0.5P4.5 AT  [SOP-6_L7.0-W7.0-P2.54-LS10.3-TL-CW]  116.54 68.42 180 bottom
U100  WF100E 1BG S6 DA 0.5P4.5 AT  [SOP-6_L7.0-W7.0-P2.54-LS10.3-TL-CW]  127.54 68.42 180 bottom
U101  WF100E 1BG S6 DA 0.5P4.5 AT  [SOP-6_L7.0-W7.0-P2.54-LS10.3-TL-CW]  138.54 68.42 180 bottom
U102  WF100E 1BG S6 DA 0.5P4.5 AT  [SOP-6_L7.0-W7.0-P2.54-LS10.3-TL-CW]  149.54 68.42 180 bottom
U103  WF100E 1BG S6 DA 0.5P4.5 AT  [SOP-6_L7.0-W7.0-P2.54-LS10.3-TL-CW]  160.54 68.42 180 bottom
U104  WF100E 1BG S6 DA 0.5P4.5 AT  [SOP-6_L7.0-W7.0-P2.54-LS10.3-TL-CW]  171.54 68.42 180 bottom
U105  WF100E 1BG S6 DA 0.5P4.5 AT  [SOP-6_L7.0-W7.0-P2.54-LS10.3-TL-CW]  182.54 68.42 180 bottom
U106  TPS7B7702QPWPRQ1  [HTSSOP-16_L5.0-W4.4-P0.65-LS6.4-BL-EP]  107.77 -353.68 0 top
U107  TPSPX3819M5-L-5-0  [SOT-23-5_L2.9-W1.6-P0.95-LS2.8-BR]  112.52 -380.75 0 top
U108  PY32F040R1BT6  [LQFP-64_L10.0-W10.0-P0.50-LS12.0-BL]  81.64 -347.67 0 top
U109  TD301M485  [COMM-TH_TD301M485]  114.2 -328.68 0 top
U110  M117  [DFN-6_L2.0-W2.0-P0.65-BL-EP1.2]  145.39 -331.23 0 top
U111  M117  [DFN-6_L2.0-W2.0-P0.65-BL-EP1.2]  145.39 -342.59 0 top
U112  M117  [DFN-6_L2.0-W2.0-P0.65-BL-EP1.2]  145.39 -349.96 0 top
U113  M117  [DFN-6_L2.0-W2.0-P0.65-BL-EP1.2]  145.39 -355.36 0 top
X1  8MHz  [CRYSTAL-SMD_4P-L3.2-W2.5-BL]  -49.08 -225.63 0 top

## Footprints (pads in the part's own frame, mm; a bottom-side part is the same pattern mirrored in y, then rotated)
C0603
  rect 0.8x0.9 smd: 1(-0.7,0) 2(0.7,0)
C0805
  rect 1.41x1.35 smd: 1(-1,0) 2(1,0)
COMM-TH_TD301M485
  rect 1.6x1.6 hole 1: 1(-3.81,-3.81)
  round 1.6 hole 1: 2(-1.27,-3.81) 3(1.27,-3.81) 4(3.81,-3.81) 5(3.81,3.81) 6(1.27,3.81) 7(-1.27,3.81) 8(-3.81,3.81)
CONN-TH_2P-P2.50_DB2EVC-2.5-2P-GN
  round 2 hole 1.4: 1(-1.25,0) 2(1.25,0)
CRYSTAL-SMD_4P-L3.2-W2.5-BL
  rect 1.4x1.2 smd: 1(-1.1,-0.85) 2(1.1,-0.85) 3(1.1,0.85) 4(-1.1,0.85)
DC-IN-TH_DC-005-5A-2.0
  oval 1.8x4.2 hole 1x3.5: 1(3,2.352)
  oval 1.8x4 hole 1x3.3: 2(-3,2.352)
  oval 4x1.8 hole 3.3x1: 3(-0.001,-2.352)
dc-in-th_dc-012a-b200
  oval 1.5x4.2 hole 0.8x3.5: 1(-2.975,2.615)
  oval 3.5x1.5 hole 2.8x0.8: 2(-0.305,-2.615) 3(2.975,-0.115)
DFN-6_L2.0-W2.0-P0.65-BL-EP1.2
  rect 0.28x0.55 smd: 1(-0.65,-0.9) 2(0.001,-0.9) 3(0.65,-0.9) 4(0.65,0.9) 5(0,0.9) 6(-0.65,0.9)
  rect 1.3x0.8 smd: 7(0.001,0)
HDR-TH_4P-P2.54-V-M
  rect 1.7x1.7 hole 1.1: 1(-3.81,0)
  round 1.7 hole 1.1: 2(-1.27,0) 3(1.27,0) 4(3.81,0)
HTSSOP-16_L5.0-W4.4-P0.65-LS6.4-BL-EP
  oval 0.343x1.746 smd: 1(-2.275,-2.873) 2(-1.625,-2.873) 3(-0.975,-2.873) 4(-0.325,-2.873) 5(0.325,-2.873) 6(0.975,-2.873) 7(1.625,-2.873) 8(2.275,-2.873) 9(2.275,2.873) 10(1.625,2.873) 11(0.975,2.873) 12(0.325,2.873) 13(-0.325,2.873) 14(-0.975,2.873) 15(-1.625,2.873) 16(-2.275,2.873)
  rect 3.55x2.46 smd: 17(0,0)
LED_0603
  rect 0.8x0.8 smd: 1(-0.851,-0.01) 2(0.75,-0.005)
LQFP-64_L10.0-W10.0-P0.50-LS12.0-BL
  oval 0.3x1.5 smd: 1(-3.75,-5.688) 2(-3.25,-5.688) 3(-2.75,-5.688) 4(-2.25,-5.688) 5(-1.75,-5.688) 6(-1.25,-5.688) 7(-0.75,-5.688) 8(-0.25,-5.688) 9(0.25,-5.688) 10(0.75,-5.688) 11(1.25,-5.688) 12(1.75,-5.688) 13(2.25,-5.688) 14(2.75,-5.688) 15(3.25,-5.688) 16(3.75,-5.688) 33(3.75,5.688) 34(3.25,5.688) 35(2.75,5.688) 36(2.25,5.688) 37(1.75,5.688) 38(1.25,5.688) 39(0.75,5.688) 40(0.25,5.688) 41(-0.25,5.688) 42(-0.75,5.688) 43(-1.25,5.688) 44(-1.75,5.688) 45(-2.25,5.688) 46(-2.75,5.688) 47(-3.25,5.688) 48(-3.75,5.688)
  oval 1.5x0.3 smd: 17(5.7,-3.738) 18(5.7,-3.238) 19(5.7,-2.738) 20(5.7,-2.238) 21(5.7,-1.738) 22(5.7,-1.238) 23(5.7,-0.739) 24(5.7,-0.238) 25(5.7,0.262) 26(5.7,0.762) 27(5.7,1.262) 28(5.7,1.762) 29(5.7,2.261) 30(5.7,2.762) 31(5.7,3.261) 32(5.7,3.762) 49(-5.7,3.762) 50(-5.7,3.261) 51(-5.7,2.762) 52(-5.7,2.261) 53(-5.7,1.762) 54(-5.7,1.262) 55(-5.7,0.762) 56(-5.7,0.262) 57(-5.7,-0.238) 58(-5.7,-0.739) 59(-5.7,-1.238) 60(-5.7,-1.738) 61(-5.7,-2.238) 62(-5.7,-2.738) 63(-5.7,-3.238) 64(-5.7,-3.738)
R0603
  rect 0.806x0.864 smd: 1(-0.753,0) 2(0.753,0)
SMA_L4.3-W2.5-LS5.0-RD
  rect 2x1.593 smd: 1(-2.1,0) 2(2.1,0)
SOP-6_L7.0-W7.0-P2.54-LS10.3-TL-CW
  round 1.5 hole 1: 1(-2.56,4.986) 2(-0.01,4.986) 3(2.54,4.986) 4(2.54,-4.59) 5(-0.01,-4.59) 6(-2.56,-4.59)
SOT-23-3_L2.9-W1.3-P1.90-LS2.4-BR
  rect 1.25x0.7 smd: 1(1,-0.95) 2(1,0.95) 3(-1,0)
SOT-23-5_L2.9-W1.6-P0.95-LS2.8-BR
  rect 1x0.6 smd: 1(1.1,-0.95) 2(1.1,0) 3(1.1,0.95) 4(-1.1,0.95) 5(-1.1,-0.95)
SOT-23_L2.9-W1.3-P1.90-LS2.4-BR
  rect 1x0.8 smd: 1(1.15,-0.95) 2(1.15,0.95) 3(-1.15,0)

## Nets
As in the schematic.
